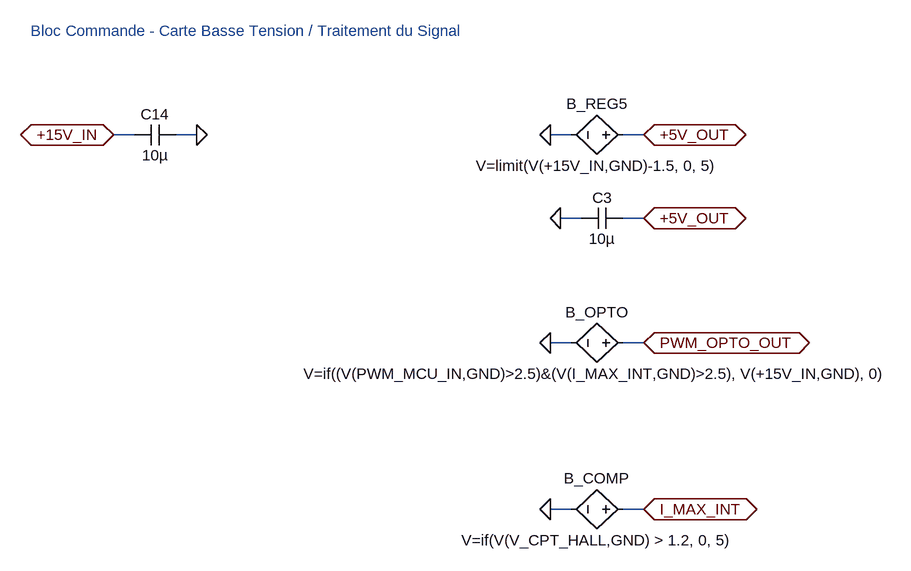
[diagram p0: schematic bloc_commande.asc]
bloc_commande.asc, the LTspice schematic file:
Version 4.1
SHEET 1 3200 2400
WIRE -16 -32 -48 -32
WIRE 80 -32 48 -32
WIRE 656 -32 624 -32
WIRE 768 -32 736 -32
WIRE 672 96 640 96
WIRE 768 96 736 96
WIRE 656 288 624 288
WIRE 768 288 736 288
WIRE 656 544 624 544
WIRE 768 544 736 544
FLAG -48 -32 +15V_IN
IOPIN -48 -32 BiDir
FLAG 80 -32 0
IOPIN 80 -32 BiDir
FLAG 768 -32 +5V_OUT
IOPIN 768 -32 BiDir
FLAG 624 -32 0
IOPIN 624 -32 BiDir
FLAG 768 96 +5V_OUT
IOPIN 768 96 BiDir
FLAG 640 96 0
IOPIN 640 96 BiDir
FLAG 768 288 PWM_OPTO_OUT
IOPIN 768 288 BiDir
FLAG 624 288 0
IOPIN 624 288 BiDir
FLAG 768 544 I_MAX_INT
IOPIN 768 544 BiDir
FLAG 624 544 0
IOPIN 624 544 BiDir
SYMBOL cap -16 -16 R270
WINDOW 0 32 32 VTop 2
WINDOW 3 0 32 VBottom 2
SYMATTR InstName C14
SYMATTR Value 10µ
SYMBOL bv 752 -32 R90
WINDOW 0 -32 56 VBottom 2
WINDOW 3 32 56 VTop 2
SYMATTR InstName B_REG5
SYMATTR Value V=limit(V(+15V_IN,GND)-1.5, 0, 5)
SYMBOL cap 736 80 R90
WINDOW 0 0 32 VBottom 2
WINDOW 3 32 32 VTop 2
SYMATTR InstName C3
SYMATTR Value 10µ
SYMBOL bv 752 288 R90
WINDOW 0 -32 56 VBottom 2
WINDOW 3 32 56 VTop 2
SYMATTR InstName B_OPTO
SYMATTR Value V=if((V(PWM_MCU_IN,GND)>2.5)&(V(I_MAX_INT,GND)>2.5), V(+15V_IN,GND), 0)
SYMBOL bv 752 544 R90
WINDOW 0 -32 56 VBottom 2
WINDOW 3 32 56 VTop 2
SYMATTR InstName B_COMP
SYMATTR Value V=if(V(V_CPT_HALL,GND) > 1.2, 0, 5)
TEXT -176 -192 Left 2 ;Bloc Commande - Carte Basse Tension / Traitement du Signal

The netlist it stands for:
* bloc_commande.asc
C14 +15V_IN 0 10µ
B_REG5 +5V_OUT 0 V=limit(V(+15V_IN,GND)-1.5, 0, 5)
C3 +5V_OUT 0 10µ
B_OPTO PWM_OPTO_OUT 0 V=if((V(PWM_MCU_IN,GND)>2.5)&(V(I_MAX_INT,GND)>2.5), V(+15V_IN,GND), 0)
B_COMP I_MAX_INT 0 V=if(V(V_CPT_HALL,GND) > 1.2, 0, 5)
* Bloc Commande - Carte Basse Tension / Traitement du Signal
.backanno
.end